# EAGLE design ZHdK_MKR_SHIELD (EAGLE 9.6.2)
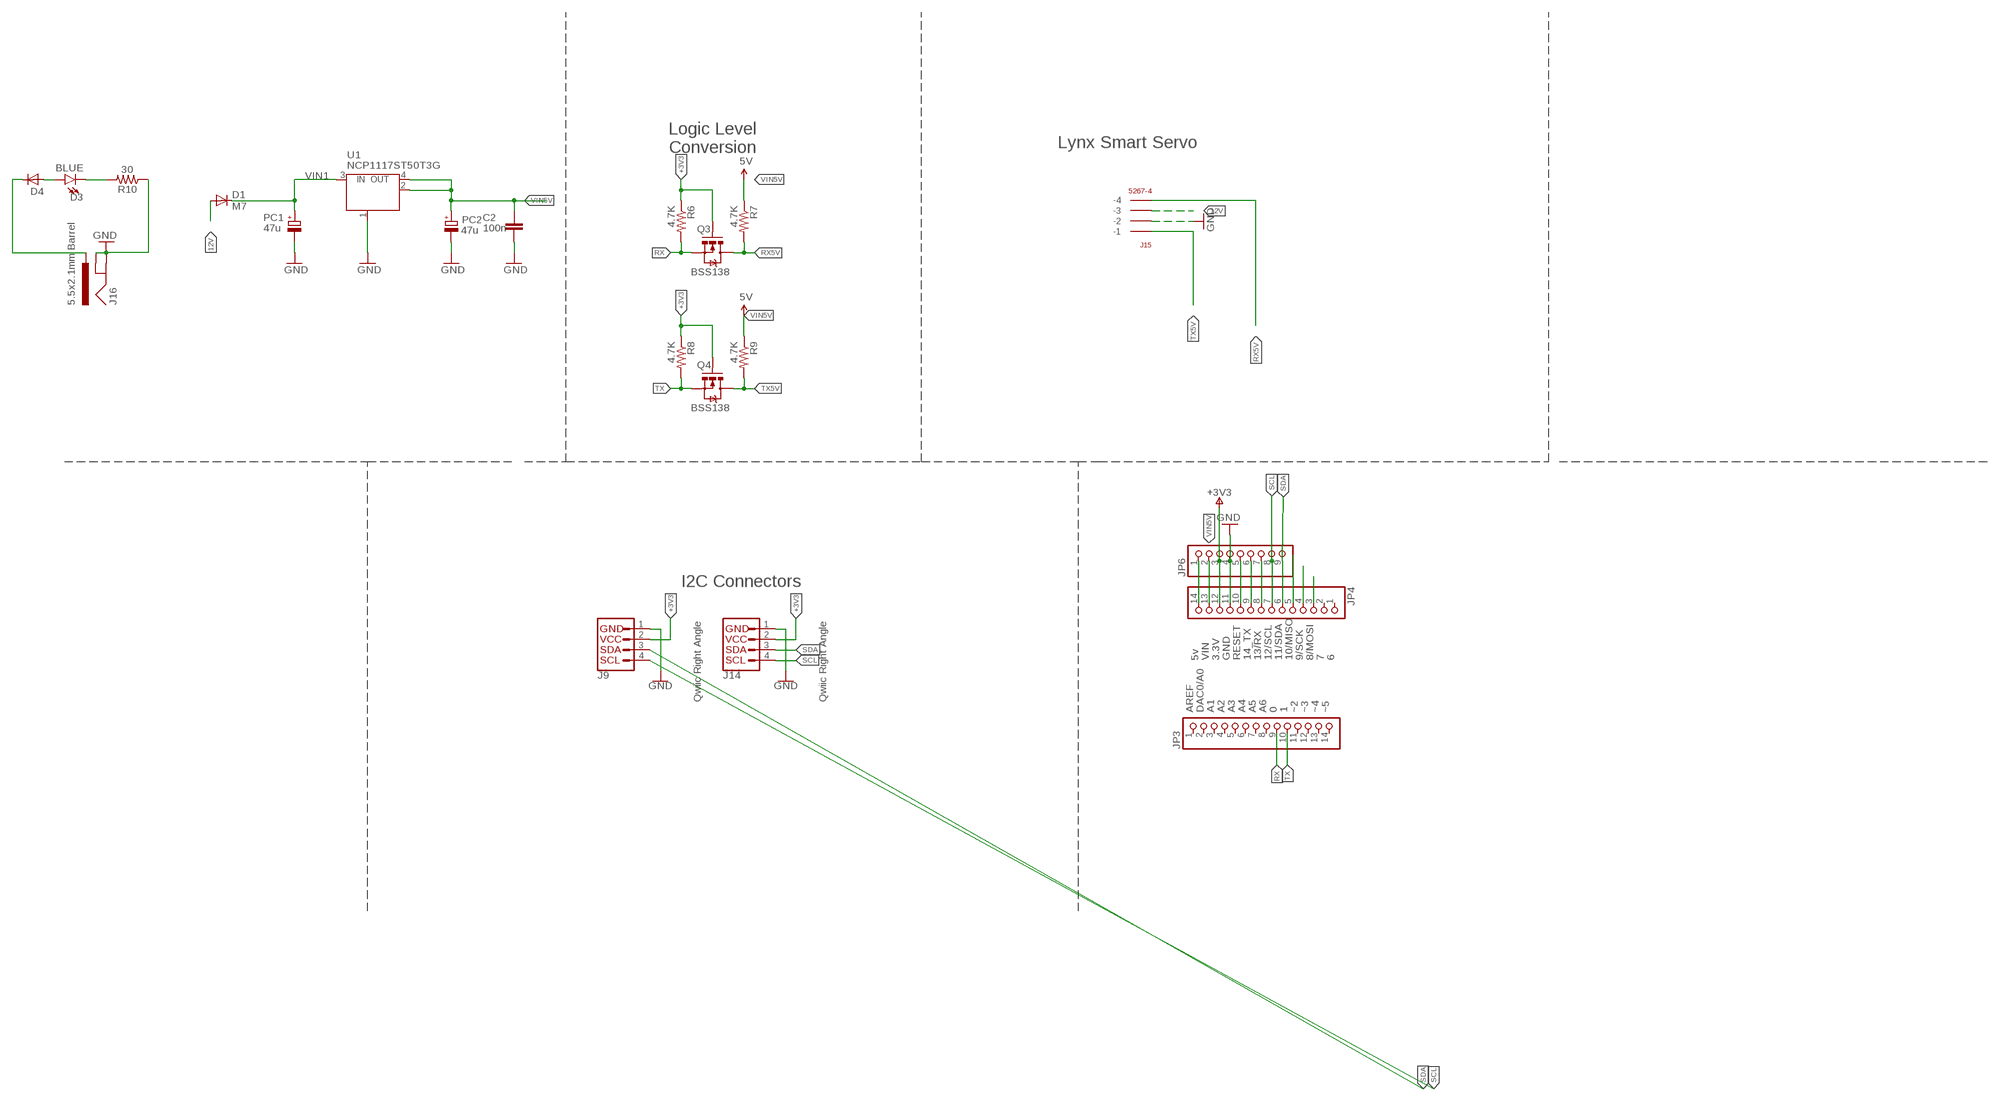
[diagram p0: schematic, sheet 1]

## Parts
C2  100n  C-EU0603-RND  [C0603-ROUND]
D1  M7  DIODE-SMB  [SMB]
D3  BLUE  LED-BLUE0603  [LED-0603]
D4  9V  DIODESOD-123  [SOD-123]
J9  Qwiic Right Angle  I2C_STANDARDQWIIC  [1X04_1MM_RA]
J14  Qwiic Right Angle  I2C_STANDARDQWIIC  [1X04_1MM_RA]
J15  5267-4  [5267-4]
J16  5.5x2.1mm Barrel  POWER_JACKSMD  [POWER_JACK_SMD]
JP3  -  PINHD-1X14TH  [1X14]
JP4  -  PINHD-1X14TH  [1X14]
JP6  PINHD-1X9  [1X09]
PC1  47u  CPOL-EUD  [PANASONIC_D]
PC2  47u  CPOL-EUD  [PANASONIC_D]
Q3  BSS138  MOSFET-NCHANNELBSS138  [SOT23-3]
Q4  BSS138  MOSFET-NCHANNELBSS138  [SOT23-3]
R6  4.7K  4.7KOHM-1/10W-1%(0603)  [0603-RES]
R7  4.7K  4.7KOHM-1/10W-1%(0603)  [0603-RES]
R8  4.7K  4.7KOHM-1/10W-1%(0603)  [0603-RES]
R9  4.7K  4.7KOHM-1/10W-1%(0603)  [0603-RES]
R10  30  0.05OHM-0603-1/5W-1%  [0603]
U1  NCP1117ST50T3G  MC33269ST-3.3T3  [SOT223]

## Nets
12V [HV]: D1.A D4.C J15.P$3(-3) J16.VIN0(PWR)
+3V3 [power]: J9.2 J14.2 JP4.12 JP6.3 Q3.1(G) Q4.1(G) R6.1 R8.1
GND [gnd]: C2.1 J9.1 J14.1 J15.P$2(-2) J16.GND(GNDBREAK) J16.P$4(GND) JP4.11 JP6.4 PC1.- PC2.- R10.1 U1.1(GND/ADJ)
N$1: JP4.14 JP6.1
N$31: JP4.10 JP6.5
N$32: JP4.9 JP6.6
N$33: JP4.8 JP6.7
N$63: JP4.3
N$64: JP4.4
N$65: JP4.5
N$251: D3.A D4.A
N$252: D3.C R10.2
RX: JP3.9 Q3.2(S) R6.2
RX5V: J15.P$4(-4) Q3.3(D) R7.2
SCL: J9.4 J14.4 JP4.7 JP6.8
SDA: J9.3 J14.3 JP4.6 JP6.9
TX: JP3.10 Q4.2(S) R8.2
TX5V: J15.P$1(-1) Q4.3(D) R9.2
VIN1 [power]: D1.C PC1.+ U1.3(IN)
VIN5V [power]: C2.2 JP4.13 JP6.2 PC2.+ R7.1 R9.1 U1.2(OUT) U1.4(OUT) ; supply symbol labelled 5V
Unconnected: JP3.1 JP3.2 JP3.3 JP3.4 JP3.5 JP3.6 JP3.7 JP3.8 JP3.11 JP3.12 JP3.13 JP3.14 JP4.1 JP4.2

## Notes on the sheet
- Logic Level
  Conversion
- Lynx Smart Servo
- I2C Connectors
- 5v | VIN | 3.3V | GND | RESET | 14_TX | 13/RX | 12/SCL | 11/SDA | 10/MISO | 9/SCK | 8/MOSI | 7 | 6
- AREF | DAC0/A0 | A1 | A2 | A3 | A4 | A5 | A6 | 0 | 1 | ~2 | ~3 | ~4 | ~5

## Library data of the parts
C2 = SmartPrj:C-EU: CAPACITOR, European symbol
D1 = diode:DIODE-: DIODE
D3 = SparkFun-LED:LED-BLUE: Blue SMD LED Used in manufacturing of various products at SparkFun Packages: 0603 - SMD 0603 package [Product Link] <http://www.digikey.com/product-detail/en/SMLE12BC7TT86/511-1589-2-ND/1641808> 1206 - SMD1206 package [Product Link] <http://www.digikey.com/product-detail/en/lite-on-inc/LTST-C150TBKT/160-1643-1-ND/573584> SparkFun Products: ESP8266 Thing-Dev Board <https://www.sparkfun.com/products/13711> RedBoard <https://www.sparkfun.com/products/12757>; PROD_ID: DIO-08575
D4 = adafruit:DIODE: Diode SMADIODE - SMA Surface Mount Package 20V 1A Schottky Diode Digikey: 641-1014-6-ND DO-1N4148 - Through Hole Small Current Diode SOD-123 20V 1 A (.5mV Vf) Schottky Diode - Digikey: MBRX120TPMSCT-ND SOD-323 10V 570mA (.38mV Vf, 3ns) Schottky Diode - Digikey: ZLLS410CT-ND SOD-523 30V 30mA Schottky Diode (RB751S-40TE61) - Digikey: RB751S-40TE61CT-ND SOT23-R/W - SOT23 Package (R = Solder Paste/Reflow Ovens, W = Hand-Soldering) BAT54Film 40V 300mA - Digikey: 497-7162-1-ND
J9 J14 = SparkFun-Connectors:I2C_STANDARD: SparkFun I2C Standard Pinout Header SparkFun has standardized on a pinout for all I2C based sensor breakouts. This pinout allows I2C boards to be plugged directly into the headers on Arduino Uno compatible boards, and to be daisy chained easily. Example SparkFun Products: SparkFun Atmospheric Sensor Breakout - BME280 <https://www.sparkfun.com/products/13676> SparkFun Altitude/Pressure Sensor Breakout - MPL3115A2 <https://www.sparkfun.com/products/11084> SparkFun TOF Range Finder Sensor - VL6180 <https://www.sparkfun.com/products/12785>; PROD_ID: CONN-13694
J15 = con-molex-spox:5267-4
J16 = SparkFun-Connectors:POWER_JACK: Power Jack Connector This is the standard 5.5mm barrel jack for power. The PTH is the most common, proven, reliable, footprint. The Slot footprint only works if the mill layer is transmitted to the PCB fab house so be warned. Here are the connectors we sell at SparkFun: DC Barrel Power Jack/Connector <https://www.sparkfun.com/products/119> (PRT-00119) DC Barrel Power Jack/Connector (SMD) <https://www.sparkfun.com/products/12748> (PRT-12748) DC Barrel Jack Adapter - Breadboard Compatible <https://www.sparkfun.com/products/10811> (PRT-10811) It is used on this SparkFun product (and many, many others): SparkFun RedBoard - Programmed with Arduino <https://www.sparkfun.com/products/12757> (DEV-12757) Also, if you need a mating power supply or connector, please check these out: Wall Adapter Power Supply - 9VDC 650mA <https://www.sparkfun.com/products/298> (TOL-00298) DC Barrel Jack Adapter - Male <https://www.sparkfun.com/products/10287> (PRT-10287); PROD_ID: CONN-08106; SF_ID: PRT-12748
JP3 JP4 = Arduino-connectors:PINHD-1X14: PIN HEADER; CODE-BCE: -; CODE-TK2: -; DATASHEET: -; DISTRIBUTOR-LINK: -; DISTRIBUTOR-PN: -; MANUFACTURER: ELDECO; MANUFACTURER-PN: FH254114DF08500T
JP6 = pinhead:PINHD-1X9: PIN HEADER
PC1 PC2 = rcl:CPOL-EU: POLARIZED CAPACITOR, European symbol
Q3 Q4 = SparkFun-DiscreteSemi:MOSFET-NCHANNEL: Common NMOSFET Parts MFG P/N Store ID Prod ID FDD8780 TRANS-09984 SI7820DN TRANS-11055 FDS6630A IC-08089 2N7002PW TRANS-11151 FQP30N06L COM-10213 TRANS-10060 BSS123LT1G TRANS-08345 BSS138 TRANS-00830 BS170 2N7000; PROD_ID: TRANS-00830; VALUE: 200mA/50V
R6-R9 = SparkFun-Resistors:4.7KOHM-1/10W-1%(0603): RES-07857; PROD_ID: RES-07857
R10 = SparkFun-Resistors:0.05OHM: 0.05Ω resistor A resistor is a passive two-terminal electrical component that implements electrical resistance as a circuit element. Resistors act to reduce current flow, and, at the same time, act to lower voltage levels within circuits. - Wikipedia; PROD_ID: RES-12535; VALUE: 0.05
U1 = linear:MC33269ST*: Adjustable Output Low Dropout Voltage Regulator 800 mA Source: http://www.onsemi.com/pub/Collateral/MC33269-D.PDF

## Net classes
0 Default: width 0.203 mm
1 power: width 0.61 mm, drill 0.61 mm, clearance 0.254 mm
2 gnd: width 0.305 mm, drill 0.559 mm, clearance 0.254 mm
3 HV: width 1.016 mm, drill 0.61 mm, clearance 0.254 mm to class 0, clearance 0.254 mm to class 1, clearance 0.254 mm to class 2, clearance 0.254 mm

## Board
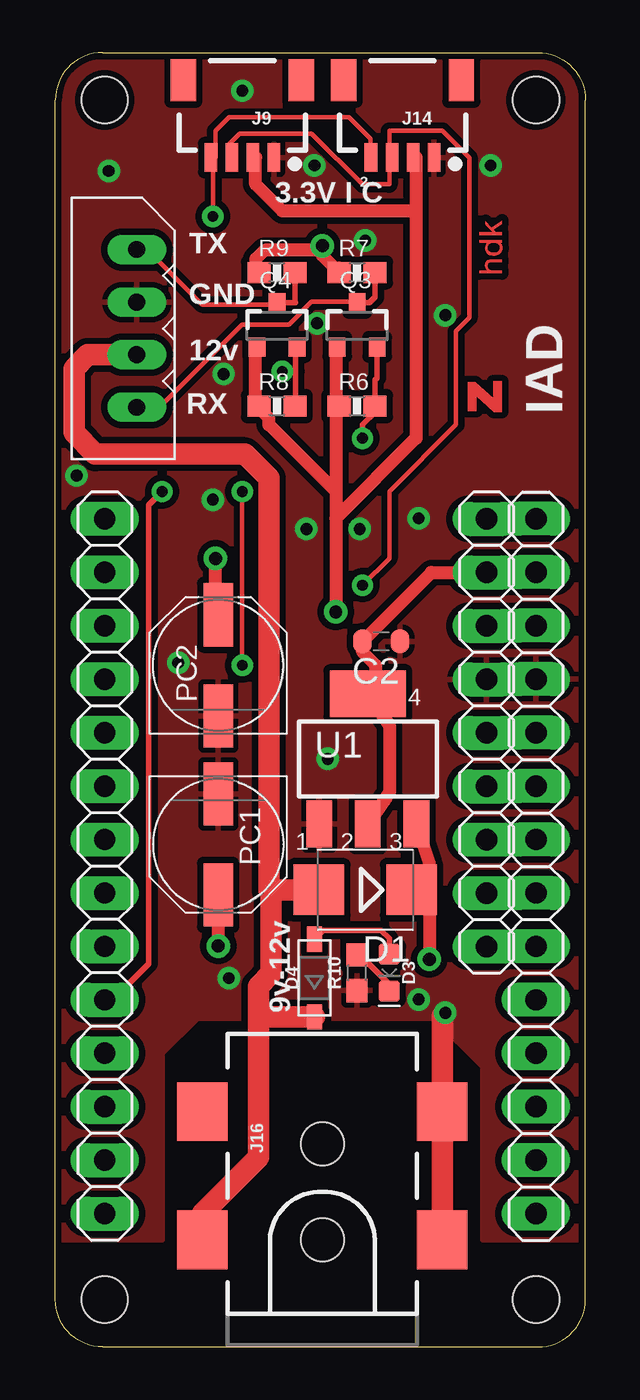
[diagram p1: board, top side]
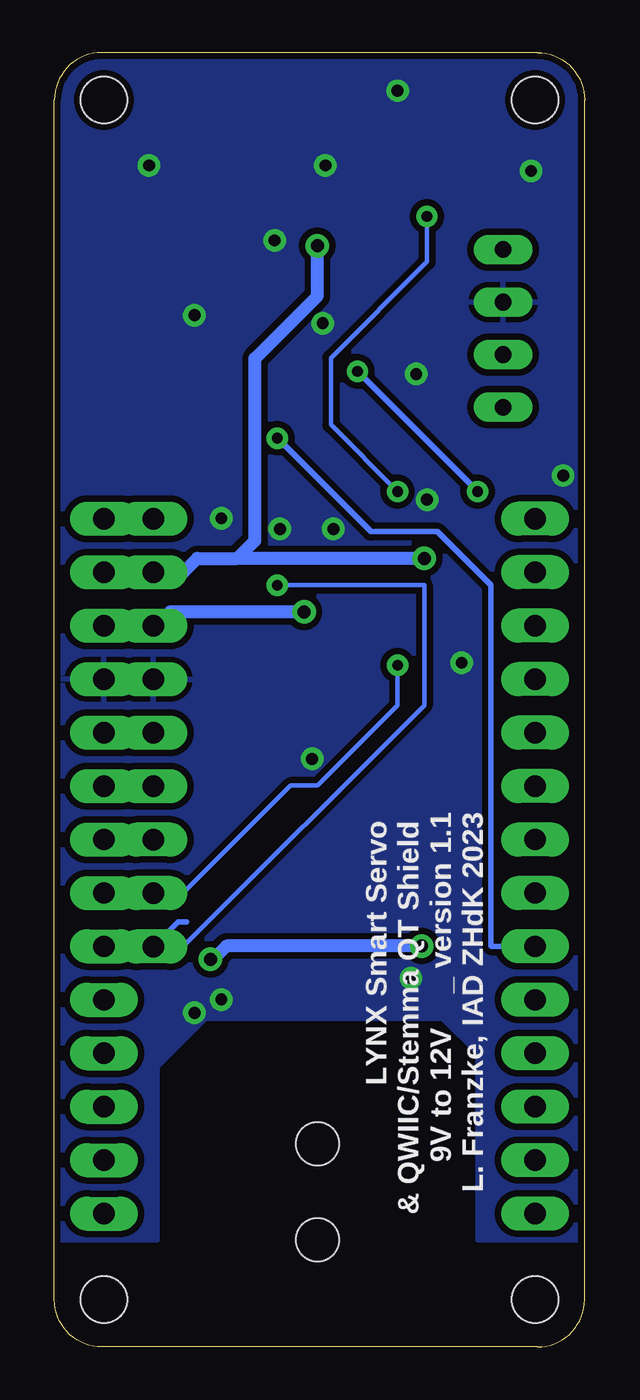
[diagram p2: board, bottom side, seen from below]

Size 25.2 x 61.5 mm. Coordinates in mm from the lower left corner, seen from the top.
Outline: 25.2,2.25 25.2,59.25 arc90 22.95,61.5 2.25,61.5 arc90 0,59.25 0,2.25 arc90 2.25,0 22.95,0 arc90 25.2,2.25
Copper layers (1*16): Top 0.035mm / dielectric 1.5mm / Bottom 0.035mm
Design rules "SparkFun": minimum track width 8mil, minimum drill 20mil, track to track 8mil, track to pad 8mil, pad to pad 8mil, via to via 8mil, smd to smd 8mil, copper to edge 10mil, drill to drill 8mil, minimum pad ring 12mil, minimum via ring 10mil, stop-mask expansion 4mil, vias tented up to drill 25mil, thermal gap 10mil
Holes 2.2 mm at 2.35,2.25 22.85,2.25 2.35,59.25 22.85,59.25

### Footprints (pad centres in the part's own frame; a part is rotated, then mirrored left to right if it is on the bottom)
C0603-ROUND = smd 0.898 x 1.1: 1 -0.889,0; 2 0.889,0
SMB = smd 2.4 x 2.4: A 2.2,0; C -2.2,0
LED-0603 = smd 1 x 1: A -0.877,0; C 0.877,0
SOD-123 = smd 1.2 x 0.7: A 1.85,0; C -1.85,0
1X04_1MM_RA = smd 0.6 x 1.35: 1 -1.5,0; 2 -0.5,0; 3 0.5,0; 4 1.5,0 | smd 1.2 x 2: NC1 2.8,-3.675; NC2 -2.8,-3.675
5267-4 = drill 0.8 long: P$1 0,0; P$2 2.5,0; P$3 5,0; P$4 7.5,0
POWER_JACK_SMD = smd 2.8 x 2.4: GND 0,-5.7; P$4 6.1,-5.7; VIN0 0,5.7; VIN1 6.1,5.7 | hole 2.032: 0,0; 4.572,0
1X14 = drill 1.016 long: 1 -16.51,0; 2 -13.97,0; 3 -11.43,0; 4 -8.89,0; 5 -6.35,0; 6 -3.81,0; 7 -1.27,0; 8 1.27,0; 9 3.81,0; 10 6.35,0; 11 8.89,0; 12 11.43,0; 13 13.97,0; 14 16.51,0
1X09 = drill 1.016 long: 1 -10.16,0; 2 -7.62,0; 3 -5.08,0; 4 -2.54,0; 5 0,0; 6 2.54,0; 7 5.08,0; 8 7.62,0; 9 10.16,0
PANASONIC_D = smd 3 x 1.4: + 2.4,0; - -2.4,0
SOT23-3 = smd 0.8 x 0.9: 1 -0.95,-1; 2 0.95,-1; 3 0,1.1
0603-RES = smd 1.1 x 1: 1 -0.85,0; 2 0.85,0
0603 = smd 1.1 x 1: 1 -0.85,0; 2 0.85,0
SOT223 = smd 1.219 x 2.235: 1 -2.311,-3.099; 2 0,-3.099; 3 2.311,-3.099 | smd 3.6 x 2.2: 4 0,3.099

### Placement (x,y rotation side)
C2  15.49,33.53 180 top
D1  14.73,21.72 180 top
D3  15.88,17.78 270 top
D4  12.32,17.53 90 top
J9  8.89,56.52 180 top
J14  16.51,56.52 180 top
J15  3.87,52.15 270 top
J16  12.7,5.08 90 top
JP3  2.35,22.84 270 top
JP4  22.85,22.84 90 top
JP6  20.5,29.18 270 top
PC1  7.75,23.88 270 top
PC2  7.75,32.38 90 top
Q3  14.35,48.51 0 top
Q4  10.54,48.51 0 top
R6  14.35,44.7 0 top
R7  14.35,51.05 0 top
R8  10.54,44.7 0 top
R9  10.54,51.05 0 top
R10  14.35,17.78 90 top
U1  14.86,27.94 0 top
U$2  [ZHDK_LOGO]  19.05,43.69 90 top

### Tracks (layer width: path | path; a pad name or v marks a point on that pad's centre or on a via)
12V
  Top 1.016: J16.VIN0 7,6.35 9.65,9 9.65,15.75 | 10.25,21.59 10.25,17.74 9.65,17.14 9.65,15.75 | 10.25,21.59 10.25,21.72 D1.A | D4.C 9.72,15.68 9.65,15.75 | 10.25,21.59 10.16,21.68 10.16,41.27 9.02,42.42 1.91,42.42 0.89,43.43 0.89,46.48 1.55,47.15 J15.P$3
+3V3  (via drill 0.61)
  Top 0.61: 17.14,53.98 10.79,53.98 9.53,55.24 9.53,56.52 J9.2 | 17.14,53.98 17.14,56.52 J14.2 | JP6.3 20.95,34.29 22.23,34.29 JP4.12 | 13.34,44.45 13.34,47.62 Q3.1 | 13.34,44.45 13.34,40.64 | 13.34,40.64 13.34,39.37 | 13.34,39.37 v13.34,34.92 | Q4.1 9.53,47.31 9.53,44.77 R8.1 9.84,44.45 10.16,44.13 10.16,43.81 13.34,40.64 | 13.34,44.45 R6.1 | 17.14,53.98 17.14,43.18 13.34,39.37
  Bottom 0.61: v13.34,34.92 19.68,34.92 20.32,34.29 JP6.3
GND  (via drill 0.56)
  Top 0.305: 14.61,16.51 R10.1 | 7.87,27.3 7.62,27.3 PC1.- | 18.4,15.73 v18.54,15.88
  Top 1.016: J16.GND J16.P$4 18.4,15.73
  Bottom 1.016: JP4.11 JP6.4
  other vias: 8.89,59.69 2.54,55.88 8,46.23 14.73,52.58 7.49,40.26 5.84,32.51 12.95,27.94 8.26,17.53 17.27,16.51 12.32,56.13 20.7,56.13 18.54,49.02 17.27,39.37 12.45,48.64 1.02,41.4 11.94,38.86 14.48,38.86
  pour Top (isolate 0.305): 0,62.23 25.4,62.23 25.4,5.08 20.32,5.08 20.32,13.34 18.03,15.62 6.73,15.62 5.08,13.97 5.08,5.08 0,5.08
  pour Bottom (isolate 0.305): -1.27,63.5 26.67,63.5 26.67,5.08 20.32,5.08 20.32,13.34 18.03,15.62 6.73,15.62 5.08,13.97 5.08,5.08 -1.27,5.08
N$1
  Bottom 1.016: JP6.1 JP4.14
N$31
  Bottom 1.016: JP4.10 19.5,29.19 JP6.5
N$32
  Bottom 1.016: JP4.9 19.5,26.65 JP6.6
N$33
  Bottom 1.016: JP6.7 JP4.8
N$251
  Top 0.254: D3.A 15.88,19.42 15.49,19.8 12.74,19.8 D4.A
N$252
  Top 0.254: D3.C 15.88,17.23 14.48,18.63 R10.2
RX  (via drill 0.51)
  Top 0.203: 15.24,44.45 R6.2
  Top 0.254: Q3.2 15.3,46.03 15.2,45.94 R6.2 | 15.24,44.45 14.61,43.81 v14.61,43.18
  Bottom 0.254: v14.61,43.18 10.16,38.73 6.99,38.73 4.45,36.2 4.45,19.05 4.4,19.03 JP3.9
RX5V
  Top 0.203: 14.41,49.66 12.19,49.66 11.11,48.58 8.89,48.58 4.96,44.65 J15.P$4
  Top 0.254: Q3.3 14.94,49.61 15.2,49.87 R7.2
  Top 0.61: Q3.3 14.39,49.66 14.41,49.66
SCL  (via drill 0.51)
  Top 0.203: J14.4 14.99,56.54 14.99,57.4 13.97,58.42 8.26,58.42 7.62,57.78 7.62,56.52 7.49,56.52 | v8.89,40.64 v8.89,32.38 | 7.49,56.52 v7.49,53.72 | 7.49,56.52 J9.4
  Bottom 0.203: v8.89,32.38 8.89,30.48 12.7,26.67 13.97,26.67 19.05,21.59 JP6.8 | v8.89,40.64 12.06,43.81 12.06,46.99 7.49,51.56 v7.49,53.72
  Bottom 1.016: JP4.7 19.5,21.57 JP6.8
SDA  (via drill 0.51)
  Top 0.203: 15.88,56.52 15.88,55.24 14.61,55.24 12.19,57.66 8.76,57.66 8.26,57.15 8.26,56.52 J9.3 | v14.61,36.2 15.88,37.47 15.88,40.64 19.05,43.81 19.05,48.26 19.68,48.9 19.68,56.52 18.41,57.78 15.88,57.78 15.88,56.52 | 15.88,56.52 J14.3
  Bottom 0.203: v14.61,36.2 7.62,36.2 7.62,30.48 19.05,19.05 JP6.9
  Bottom 0.254: JP6.9 19.33,20.19 19.05,20.19 18.92,20.19
  Bottom 1.016: JP4.6 19.5,19.03 JP6.9
TX  (via drill 0.51)
  Top 0.203: 11.43,47.62 Q4.2 | 11.43,45.09 R8.2
  Top 0.254: 11.43,45.09 11.43,46.35 | 11.43,46.35 11.43,47.62 | v10.79,46.35 11.43,46.35 | v5.08,40.64 4.45,40.01 4.45,18.2 2.73,16.49 JP3.10
  Bottom 0.254: v5.08,40.64 v10.79,46.35
TX5V
  Top 0.203: Q4.3 10.16,49.53 6.99,49.53 4.45,52.07 J15.P$1
  Top 0.254: Q4.3 11.43,49.61 11.39,49.65 R9.2
VIN1  (via drill 0.61)
  Top 0.61: 17.78,21.72 17.78,23.01 U1.3 | 17.78,21.72 v17.78,18.41 | 7.58,20.79 PC1.+ v7.75,19.05 | 17.78,21.72 D1.C
  Bottom 0.61: v7.75,19.05 17.02,19.05 17.78,18.29 v17.78,18.41
VIN5V  (via drill 0.61, 0.61 pad 0.61)
  Top 0.61: U1.2 15.74,26.13 15.88,26.33 15.88,29.55 U1.4 15.24,31.15 15.24,32.38 14.61,33.02 C2.2 17.88,36.8 JP6.2 | v7.62,37.47 7.62,34.92 PC2.+ | R9.1 9.53,51.22 9.53,51.69 9.95,52.11 12.49,52.11 v12.7,52.32 12.7,51.85 R7.1 13.5,51.27
  Bottom 0.61: v7.62,37.47 16.51,37.47 | 16.51,37.47 18.41,37.47 19.05,36.83 JP6.2 | v12.7,52.32 12.7,49.93 15.67,46.96 15.67,38.3 16.51,37.47
  Bottom 1.016: JP4.13 19.5,36.81 JP6.2

### Text on the board
tPlace: 3.3V I C | 2 | TX | GND | 12v | RX | IAD | 9v-12v
bPlace: LYNX Smart Servo / & QWIIC/Stemma QT Shield / 9V to 12V _ version 1.1 / L. Franzke, IAD ZHdK 2023
Measures: Measurements in mm